# EAGLE design PCB_ESP32_v12 (EAGLE 9.7.0)
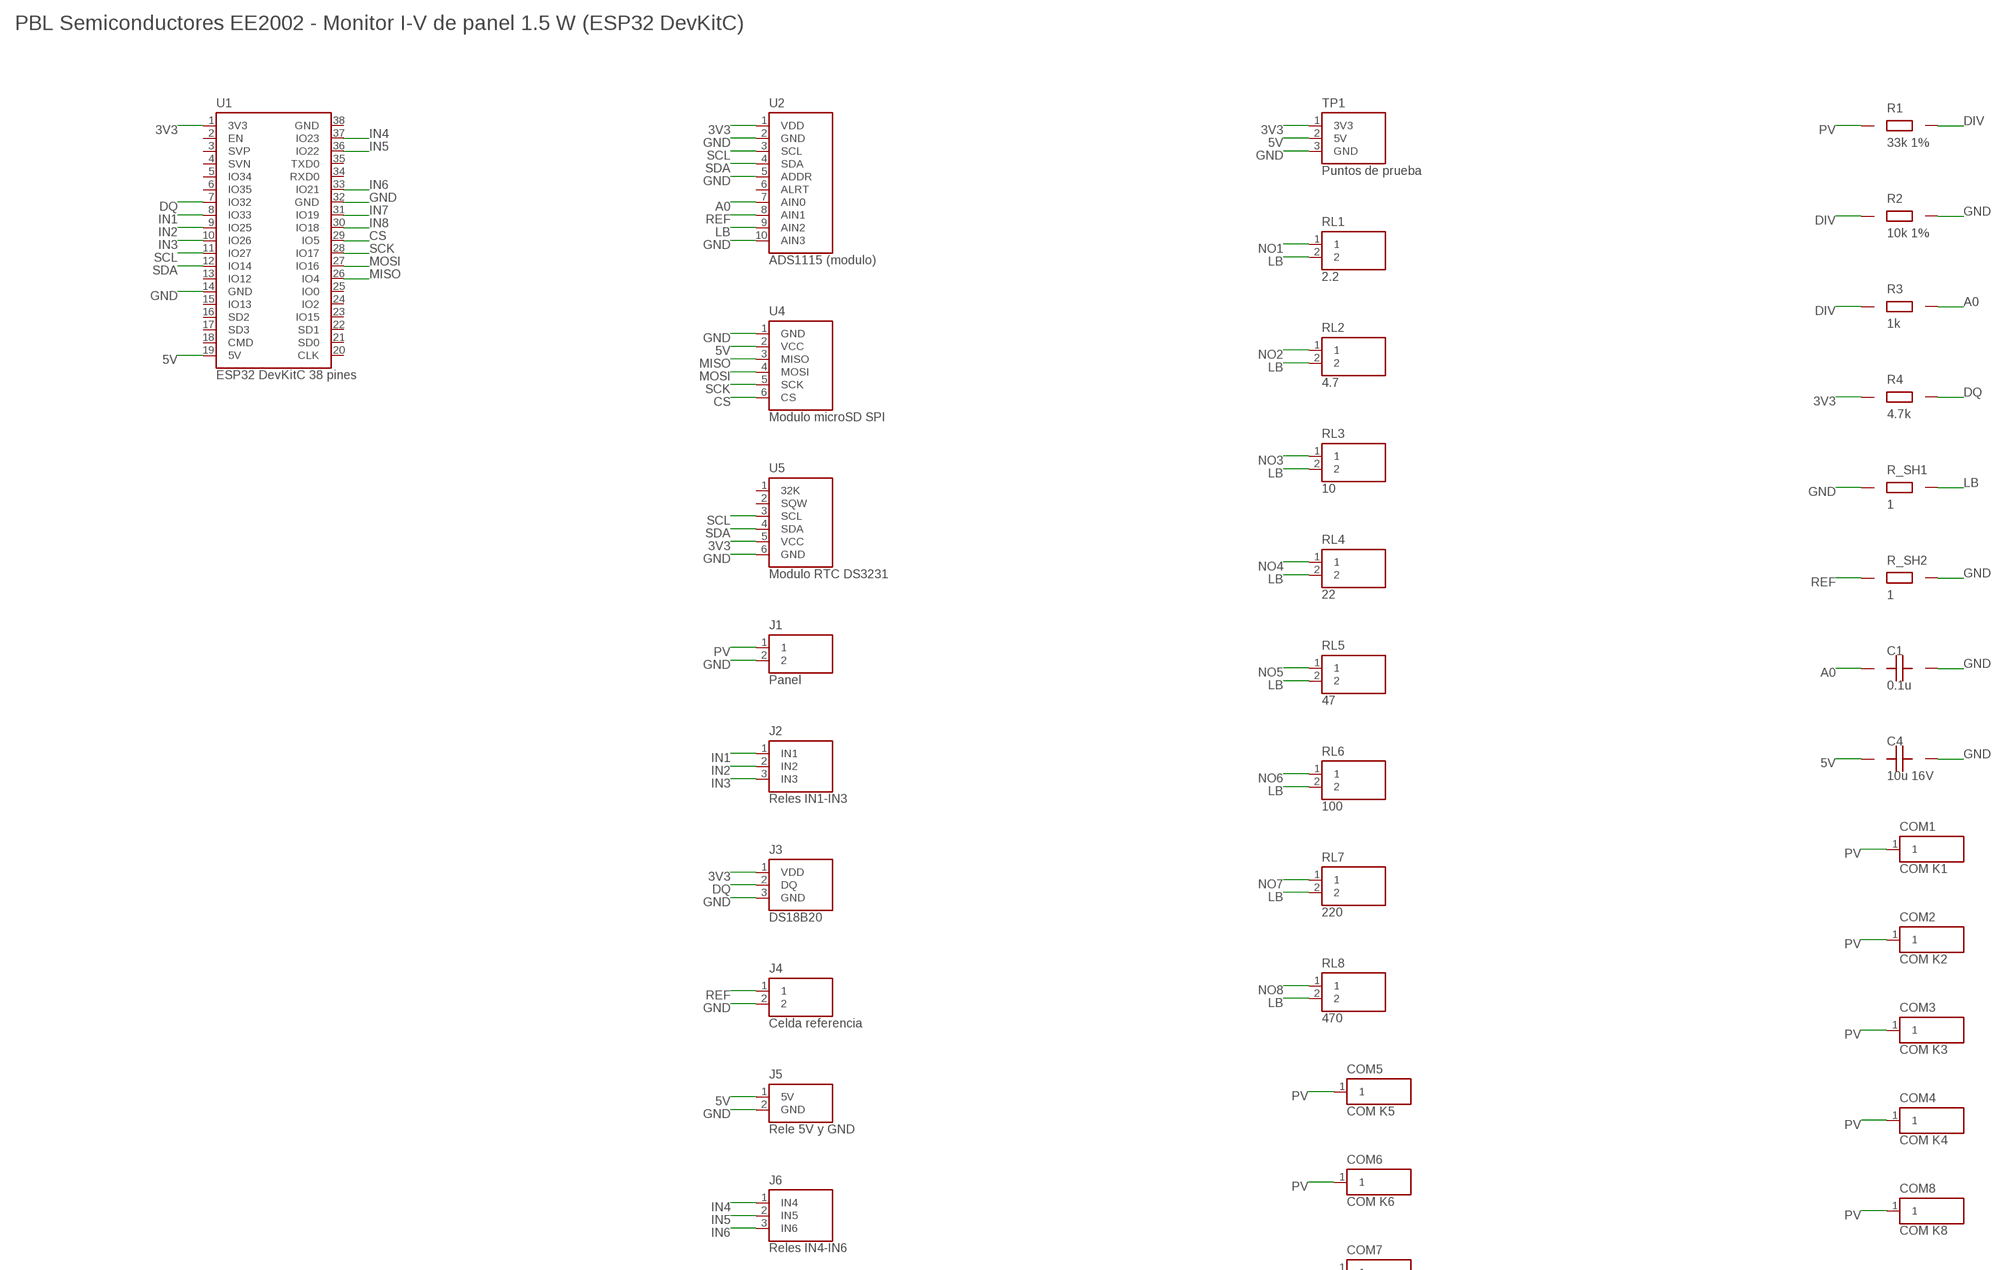
[diagram p0: schematic, sheet 1, part 1 of 2]
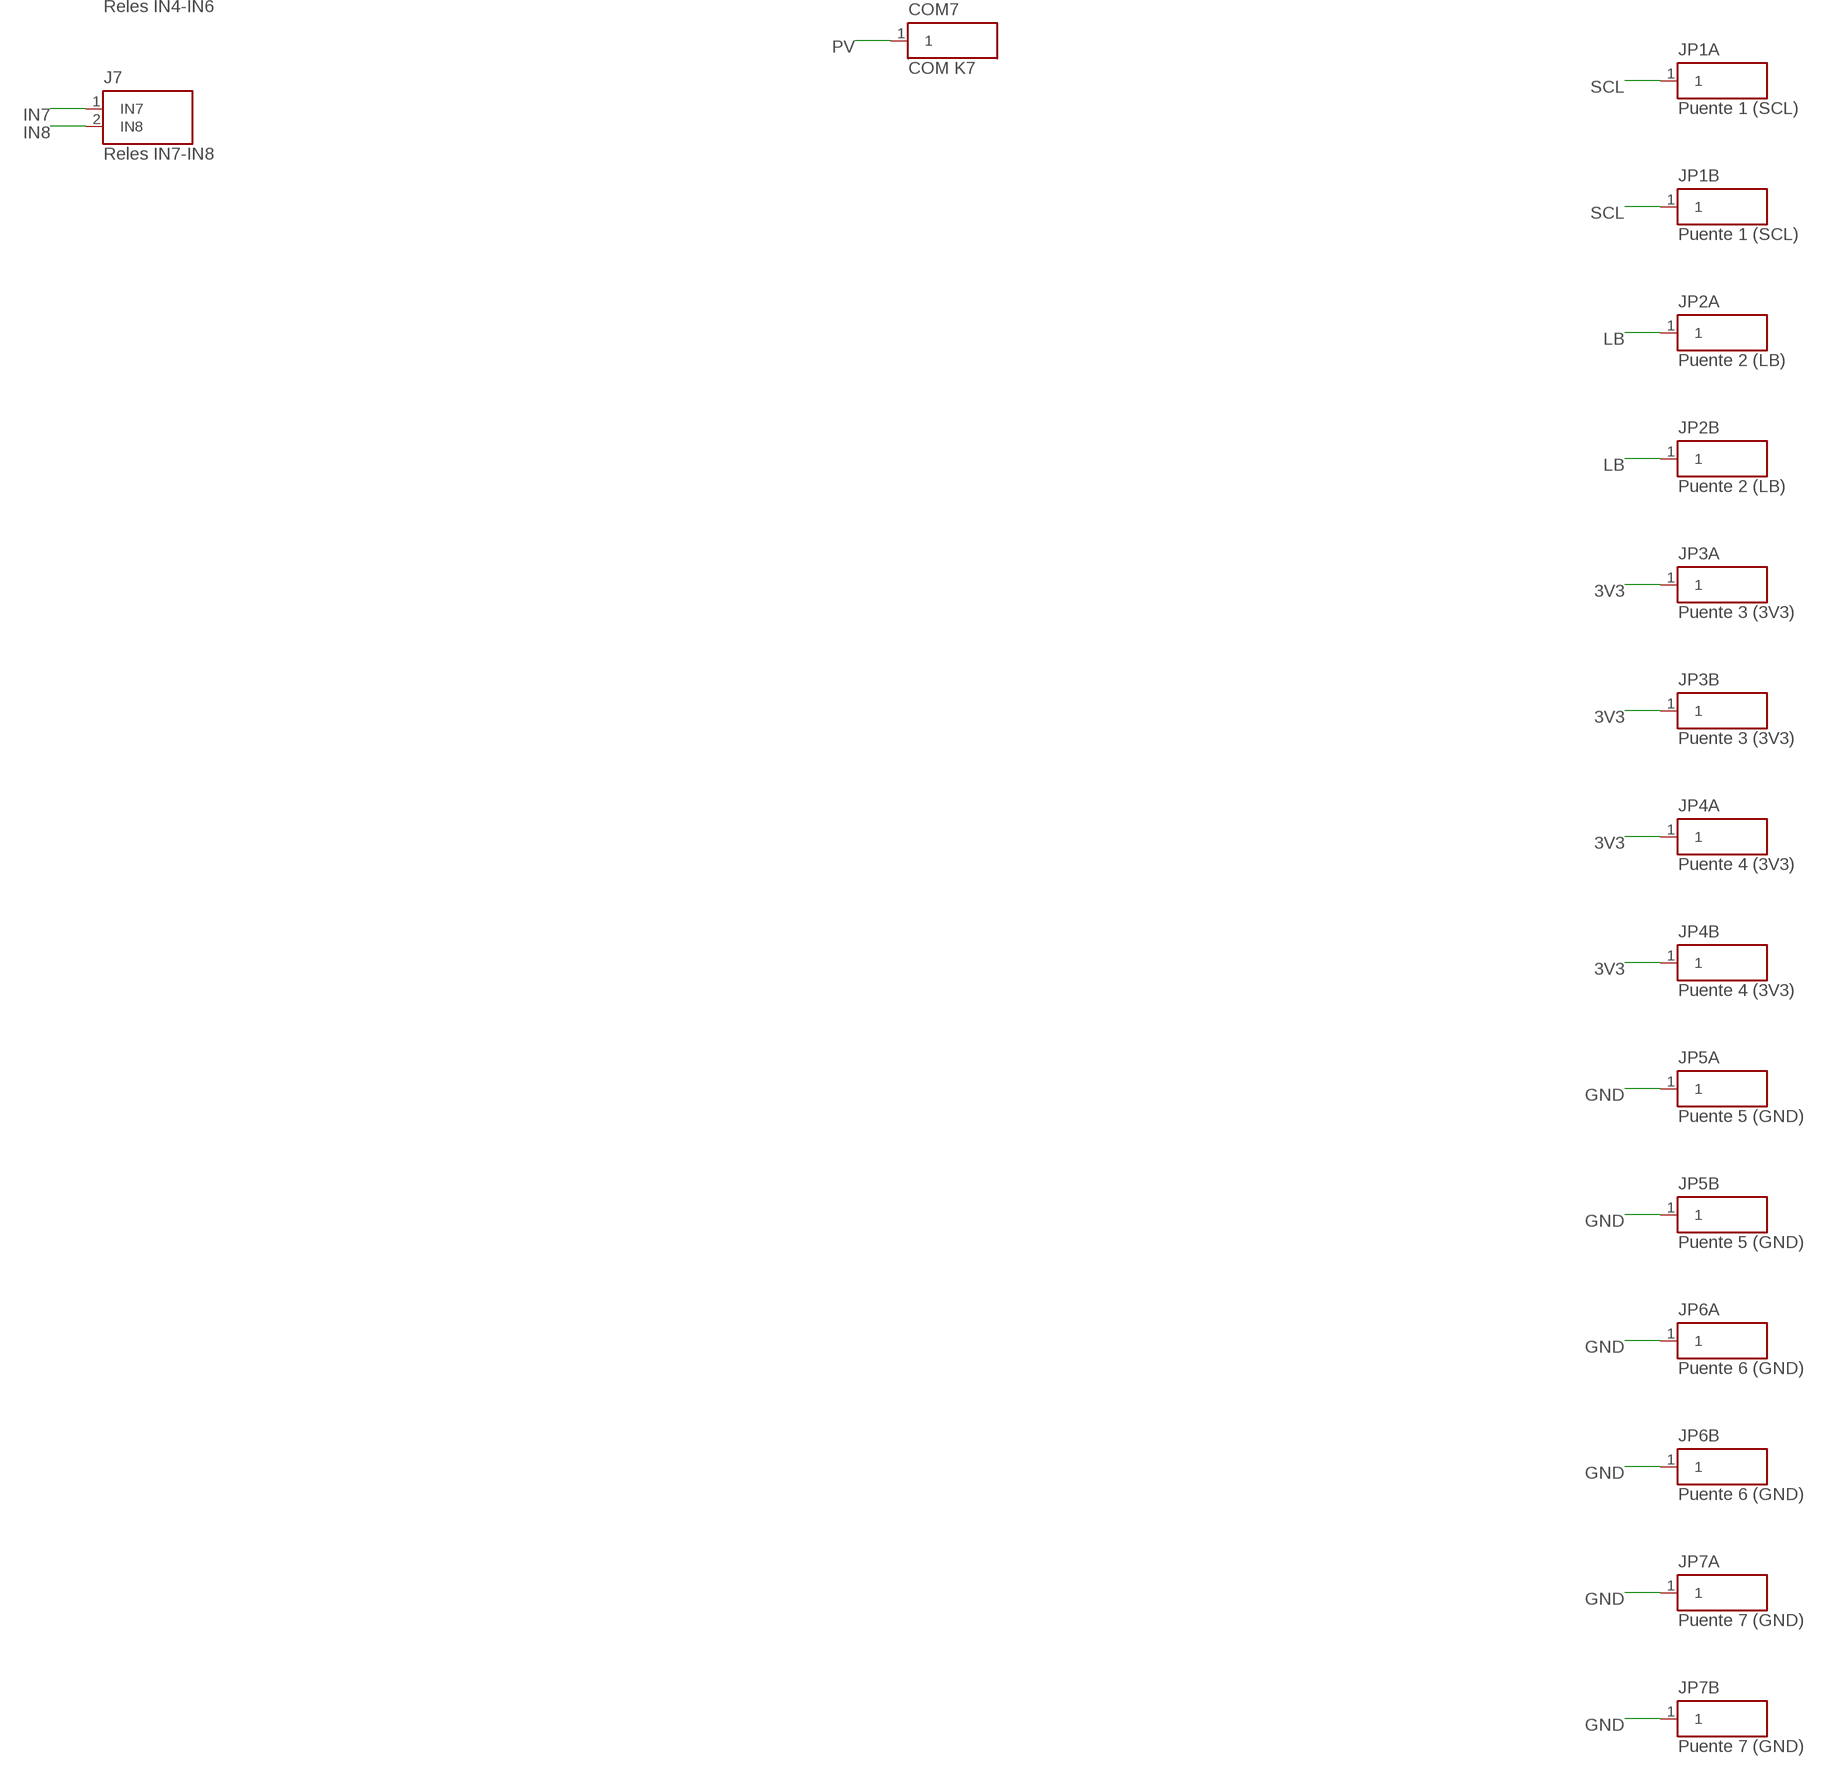
[diagram p1: schematic, sheet 1, part 2 of 2]

## Parts
C1  0.1u  C  [CAP_5MM]
C4  10u 16V  CP  [CAP_E_2_54]
COM1  COM K1  WIREPAD  [WIREPAD]
COM2  COM K2  WIREPAD  [WIREPAD]
COM3  COM K3  WIREPAD  [WIREPAD]
COM4  COM K4  WIREPAD  [WIREPAD]
COM5  COM K5  WIREPAD  [WIREPAD]
COM6  COM K6  WIREPAD  [WIREPAD]
COM7  COM K7  WIREPAD  [WIREPAD]
COM8  COM K8  WIREPAD  [WIREPAD]
J1  Panel  TERM2  [TERM2_5MM]
J2  Reles IN1-IN3  RELAY_L  [MALE_1X03]
J3  DS18B20  DS18B20_HDR  [MALE_1X03]
J4  Celda referencia  TERM2  [TERM2_5MM]
J5  Rele 5V y GND  RELAY_PWR  [MALE_1X02]
J6  Reles IN4-IN6  RELAY_RA  [MALE_1X03]
J7  Reles IN7-IN8  RELAY_RC  [MALE_1X02]
JP1A  Puente 1 (SCL)  JPAD  [JPAD]
JP1B  Puente 1 (SCL)  JPAD  [JPAD]
JP2A  Puente 2 (LB)  JPAD  [JPAD]
JP2B  Puente 2 (LB)  JPAD  [JPAD]
JP3A  Puente 3 (3V3)  JPAD  [JPAD]
JP3B  Puente 3 (3V3)  JPAD  [JPAD]
JP4A  Puente 4 (3V3)  JPAD  [JPAD]
JP4B  Puente 4 (3V3)  JPAD  [JPAD]
JP5A  Puente 5 (GND)  JPAD  [JPAD]
JP5B  Puente 5 (GND)  JPAD  [JPAD]
JP6A  Puente 6 (GND)  JPAD  [JPAD]
JP6B  Puente 6 (GND)  JPAD  [JPAD]
JP7A  Puente 7 (GND)  JPAD  [JPAD]
JP7B  Puente 7 (GND)  JPAD  [JPAD]
R1  33k 1%  R  [RES_V]
R2  10k 1%  R  [RES_V]
R3  1k  R  [RES_V]
R4  4.7k  R  [RES_V]
R_SH1  1  R  [RES_V]
R_SH2  1  R  [RES_V]
RL1  2.2  RLOAD  [RES_H_T]
RL2  4.7  RLOAD  [RES_H_T]
RL3  10  RLOAD  [RES_H_T]
RL4  22  RLOAD  [RES_H_T]
RL5  47  RLOAD  [RES_H_T]
RL6  100  RLOAD  [RES_H_T]
RL7  220  RLOAD  [RES_H_T]
RL8  470  RLOAD  [RES_H_T]
TP1  Puntos de prueba  TESTPOINTS  [MALE_1X03]
U1  ESP32 DevKitC 38 pines  ESP32  [ESP32_DEVKIT38]
U2  ADS1115 (modulo)  ADS1115  [SOCKET_1X10]
U4  Modulo microSD SPI  SDCARD  [SOCKET_1X06]
U5  Modulo RTC DS3231  DS3231  [SOCKET_1X06]

## Nets
3V3: J3.1(VDD) JP3A.1 JP3B.1 JP4A.1 JP4B.1 R4.1 TP1.1(3V3) U1.1(3V3) U2.1(VDD) U5.5(VCC)
5V: C4.1(+) J5.1(5V) TP1.2(5V) U1.19(5V) U4.2(VCC)
A0: C1.1 R3.2 U2.7(AIN0)
CS: U1.29(IO5) U4.6(CS)
DIV: R1.2 R2.1 R3.1
DQ: J3.2(DQ) R4.2 U1.7(IO32)
GND: C1.2 C4.2(-) J1.2 J3.3(GND) J4.2 J5.2(GND) JP5A.1 JP5B.1 JP6A.1 JP6B.1 JP7A.1 JP7B.1 R2.2 R_SH1.1 R_SH2.2 TP1.3(GND) U1.14(GND) U1.32(GND) U2.2(GND) U2.5(ADDR) U2.10(AIN3) U4.1(GND) U5.6(GND)
IN1: J2.1(IN1) U1.8(IO33)
IN2: J2.2(IN2) U1.9(IO25)
IN3: J2.3(IN3) U1.10(IO26)
IN4: J6.1(IN4) U1.37(IO23)
IN5: J6.2(IN5) U1.36(IO22)
IN6: J6.3(IN6) U1.33(IO21)
IN7: J7.1(IN7) U1.31(IO19)
IN8: J7.2(IN8) U1.30(IO18)
LB: JP2A.1 JP2B.1 R_SH1.2 RL1.2 RL2.2 RL3.2 RL4.2 RL5.2 RL6.2 RL7.2 RL8.2 U2.9(AIN2)
MISO: U1.26(IO4) U4.3(MISO)
MOSI: U1.27(IO16) U4.4(MOSI)
NO1: RL1.1
NO2: RL2.1
NO3: RL3.1
NO4: RL4.1
NO5: RL5.1
NO6: RL6.1
NO7: RL7.1
NO8: RL8.1
PV: COM1.1 COM2.1 COM3.1 COM4.1 COM5.1 COM6.1 COM7.1 COM8.1 J1.1 R1.1
REF: J4.1 R_SH2.1 U2.8(AIN1)
SCK: U1.28(IO17) U4.5(SCK)
SCL: JP1A.1 JP1B.1 U1.11(IO27) U2.3(SCL) U5.3(SCL)
SDA: U1.12(IO14) U2.4(SDA) U5.4(SDA)
Unconnected: U1.2(EN) U1.3(SVP) U1.4(SVN) U1.5(IO34) U1.6(IO35) U1.13(IO12) U1.15(IO13) U1.16(SD2) U1.17(SD3) U1.18(CMD) U1.20(CLK) U1.21(SD0) U1.22(SD1) U1.23(IO15) U1.24(IO2) U1.25(IO0) U1.34(RXD0) U1.35(TXD0) U1.38(GND) U2.6(ALRT) U5.1(32K) U5.2(SQW)

## Notes on the sheet
- PBL Semiconductores EE2002 - Monitor I-V de panel 1.5 W (ESP32 DevKitC)

## Library data of the parts
C1 = PCB_PBL_Semiconductores:C
C4 = PCB_PBL_Semiconductores:CP
COM1-COM8 = PCB_PBL_Semiconductores:WIREPAD
J1 J4 = PCB_PBL_Semiconductores:TERM2
J2 = PCB_PBL_Semiconductores:RELAY_L
J3 = PCB_PBL_Semiconductores:DS18B20_HDR
J5 = PCB_PBL_Semiconductores:RELAY_PWR
J6 = PCB_PBL_Semiconductores:RELAY_RA
J7 = PCB_PBL_Semiconductores:RELAY_RC
JP1A JP1B JP2A JP2B JP3A JP3B JP4A JP4B JP5A JP5B JP6A JP6B JP7A JP7B = PCB_PBL_Semiconductores:JPAD
R1-R4 R_SH1 R_SH2 = PCB_PBL_Semiconductores:R
RL1-RL8 = PCB_PBL_Semiconductores:RLOAD
TP1 = PCB_PBL_Semiconductores:TESTPOINTS
U1 = PCB_PBL_Semiconductores:ESP32
U2 = PCB_PBL_Semiconductores:ADS1115
U4 = PCB_PBL_Semiconductores:SDCARD
U5 = PCB_PBL_Semiconductores:DS3231

## Board
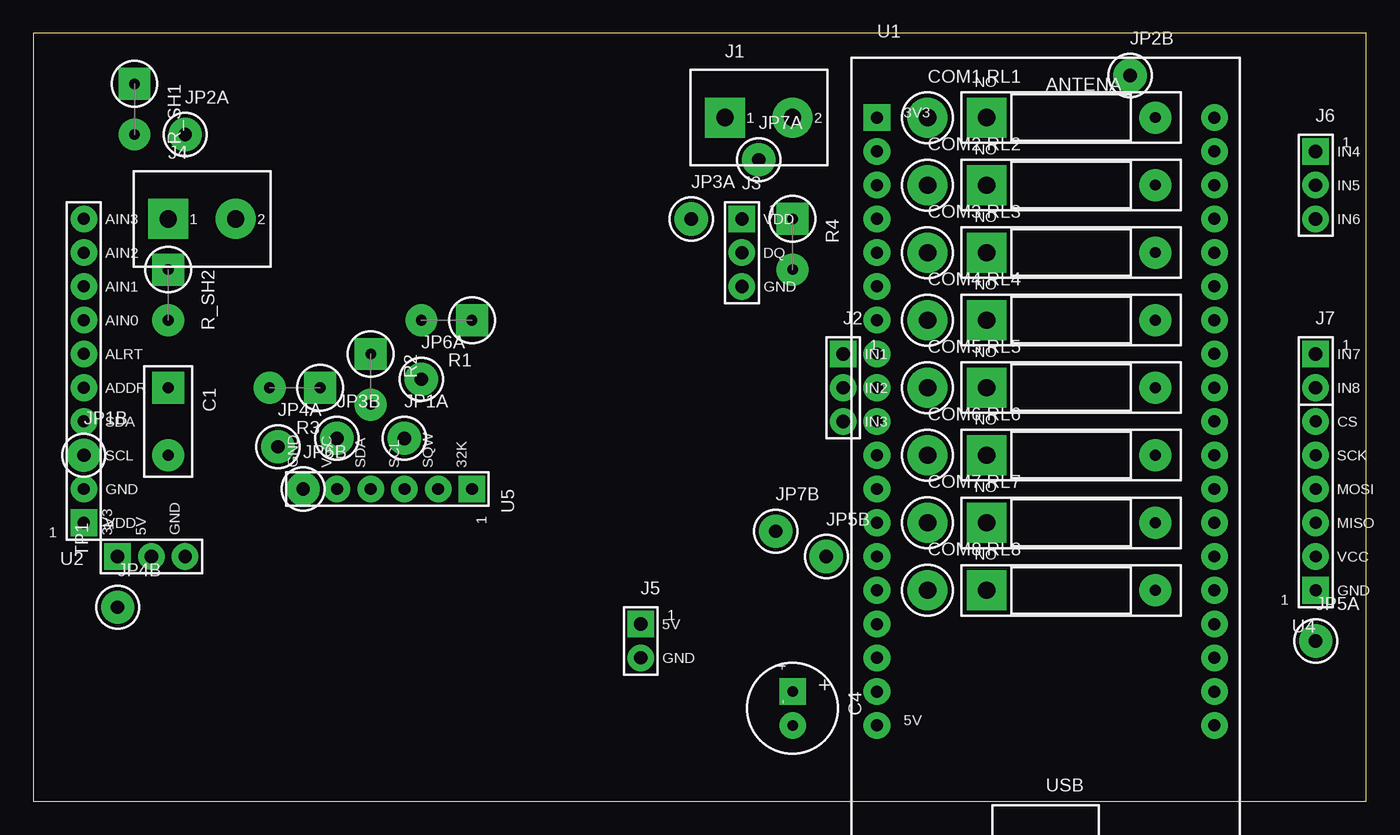
[diagram p2: board, top side]
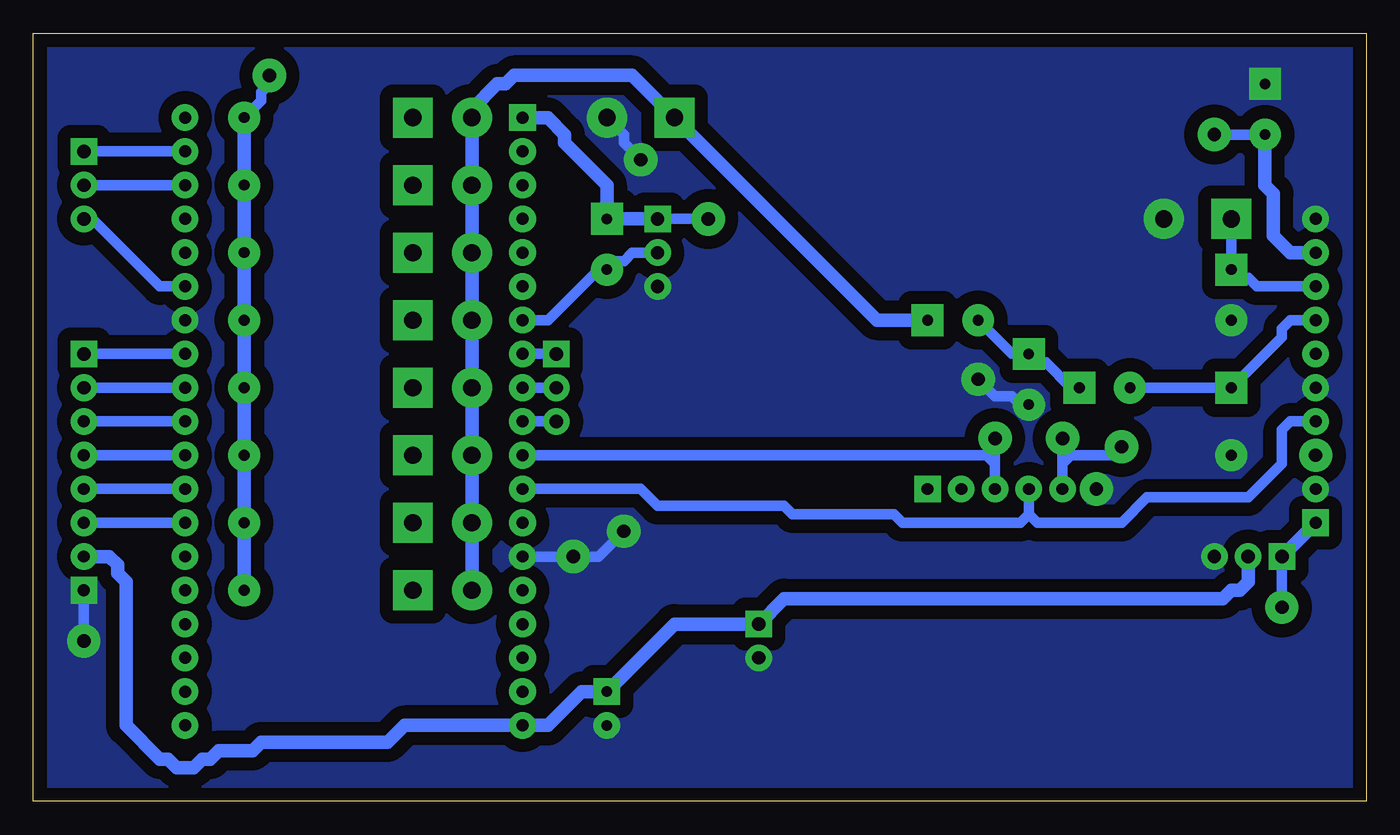
[diagram p3: board, bottom side, seen from below]

Size 100.33 x 57.79 mm. Coordinates in mm from the lower left corner, seen from the top.
Outline: 0,0 100.33,0 100.33,57.79 0,57.79 0,0
Copper layers (1*16): Top 0.035mm / dielectric 1.5mm / Bottom 0.035mm
Design rules "Fusion Electronics Design Rules": minimum track width 0.5mm, minimum drill 0.5mm, track to track 0.9mm, track to pad 0.9mm, pad to pad 0.4mm, via to via 0.4mm, smd to smd 6mil, copper to edge 1mm, drill to drill 0.3mm, minimum pad ring 0.4mm, minimum via ring 0.4mm, stop-mask expansion 4mil, vias tented up to drill 9999mil, thermal gap 0.6mm

### Footprints (pad centres in the part's own frame; a part is rotated, then mirrored left to right if it is on the bottom)
CAP_5MM = drill 0.8 pad 2.4 square: 1 0,0 | drill 0.8 pad 2.4 round: 2 5.08,0
CAP_E_2_54 = drill 0.8 pad 2 square: 1 0,0 | drill 0.8 pad 2 round: 2 2.54,0
WIREPAD = drill 1.3 pad 3 round: 1 0,0
TERM2_5MM = drill 1.3 pad 3 square: 1 0,0 | drill 1.3 pad 3 round: 2 5.08,0
MALE_1X03 = drill 1 pad 2 square: 1 0,0 | drill 1 pad 2 round: 2 0,-2.54; 3 0,-5.08
MALE_1X02 = drill 1 pad 2 square: 1 0,0 | drill 1 pad 2 round: 2 0,-2.54
JPAD = drill 1 pad 2.5 round: 1 0,0
RES_V = drill 0.8 pad 2.4 square: 1 0,0 | drill 0.8 pad 2.4 round: 2 3.81,0
RES_H_T = drill 1.3 pad 3 square: 1 0,0 | drill 0.8 pad 2.4 round: 2 12.7,0
ESP32_DEVKIT38 = drill 0.9 pad 2 square: 1 0,0 | drill 0.9 pad 2 round: 2 0,-2.54; 3 0,-5.08; 4 0,-7.62; 5 0,-10.16; 6 0,-12.7; 7 0,-15.24; 8 0,-17.78; 9 0,-20.32; 10 0,-22.86; 11 0,-25.4; 12 0,-27.94; 13 0,-30.48; 14 0,-33.02; 15 0,-35.56; 16 0,-38.1; 17 0,-40.64; 18 0,-43.18; 19 0,-45.72; 20 25.4,-45.72; 21 25.4,-43.18; 22 25.4,-40.64; 23 25.4,-38.1; 24 25.4,-35.56; 25 25.4,-33.02; 26 25.4,-30.48; 27 25.4,-27.94; 28 25.4,-25.4; 29 25.4,-22.86; 30 25.4,-20.32; 31 25.4,-17.78; 32 25.4,-15.24; 33 25.4,-12.7; 34 25.4,-10.16; 35 25.4,-7.62; 36 25.4,-5.08; 37 25.4,-2.54; 38 25.4,0
SOCKET_1X10 = drill 0.9 pad 2 square: 1 0,0 | drill 0.9 pad 2 round: 2 0,-2.54; 3 0,-5.08; 4 0,-7.62; 5 0,-10.16; 6 0,-12.7; 7 0,-15.24; 8 0,-17.78; 9 0,-20.32; 10 0,-22.86
SOCKET_1X06 = drill 0.9 pad 2 square: 1 0,0 | drill 0.9 pad 2 round: 2 0,-2.54; 3 0,-5.08; 4 0,-7.62; 5 0,-10.16; 6 0,-12.7

### Placement (x,y rotation side)
C1  10.16,31.12 270 top
C4  57.15,8.26 270 top
COM1  67.31,51.43 0 top
COM2  67.31,46.35 0 top
COM3  67.31,41.27 0 top
COM4  67.31,36.2 0 top
COM5  67.31,31.12 0 top
COM6  67.31,26.04 0 top
COM7  67.31,20.96 0 top
COM8  67.31,15.88 0 top
J1  52.07,51.43 0 top
J2  60.96,33.66 0 top
J3  53.34,43.82 0 top
J4  10.16,43.82 0 top
J5  45.72,13.34 0 top
J6  96.52,48.9 0 top
J7  96.52,33.66 0 top
JP1A  27.94,27.3 0 top
JP1B  3.81,26.04 0 top
JP2A  11.43,50.16 0 top
JP2B  82.55,54.61 0 top
JP3A  49.53,43.82 0 top
JP3B  22.86,27.3 0 top
JP4A  18.41,26.67 0 top
JP4B  6.35,14.61 0 top
JP5A  96.52,12.07 0 top
JP5B  59.69,18.41 0 top
JP6A  29.21,31.75 0 top
JP6B  20.32,23.5 0 top
JP7A  54.61,48.26 0 top
JP7B  55.88,20.32 0 top
R1  33.02,36.2 180 top
R2  25.4,33.66 270 top
R3  21.59,31.12 180 top
R4  57.15,43.82 270 top
R_SH1  7.62,53.98 270 top
R_SH2  10.16,40.01 270 top
RL1  71.75,51.43 0 top
RL2  71.75,46.35 0 top
RL3  71.75,41.27 0 top
RL4  71.75,36.2 0 top
RL5  71.75,31.12 0 top
RL6  71.75,26.04 0 top
RL7  71.75,20.96 0 top
RL8  71.75,15.88 0 top
TP1  6.35,18.41 90 top
U1  63.5,51.43 0 top
U2  3.81,20.96 180 top
U4  96.52,15.88 180 top
U5  33.02,23.5 270 top

### Tracks (layer width: path | path; a pad name or v marks a point on that pad's centre or on a via)
3V3
  Bottom 0.8: J3.1 JP3A.1 | 22.86,25.4 U5.5 22.86,25.4 | 22.86,25.4 JP3B.1 | 22.86,25.4 22.23,26.04 19.05,26.04 JP4A.1 | TP1.1 JP4B.1
  Bottom 1: U1.1 61.59,51.43 60.33,50.16 60.33,49.53 57.15,46.35 R4.1 J3.1 | TP1.1 U2.1
  tDocu 0.3: JP3A.1 JP3B.1 | JP4A.1 JP4B.1
5V
  Bottom 1: TP1.2 8.89,16.51 9.53,15.88 10.16,15.88 10.79,15.24 43.81,15.24 J5.1 52.07,13.34 C4.1 59.05,8.26 61.59,5.72 U1.19 72.39,5.72 73.66,4.45 83.19,4.45 83.82,3.81 86.36,3.81 87,3.18 87.63,3.18 88.27,2.54 89.53,2.54 90.17,3.18 90.81,3.18 93.34,5.72 93.34,16.51 93.98,17.15 93.98,17.78 94.61,18.41 U4.2
A0
  Bottom 0.8: R3.2 C1.1 6.35,34.93 6.35,35.56 5.71,36.2 U2.7
CS
  Bottom 0.8: U1.29 U4.6
DIV
  Bottom 0.8: R1.2 26.67,33.66 R2.1 24.77,33.02 24.13,33.02 22.23,31.12 R3.1
DQ
  Bottom 0.8: U1.7 61.59,36.2 57.78,40.01 R4.2 56.52,40.64 55.88,40.64 55.24,41.27 J3.2
GND
  Bottom 0.8: U4.1 JP5A.1 | JP5B.1 U1.14 JP5B.1 | R2.2 26.04,29.84 26.67,30.48 27.94,30.48 JP6A.1 | J1.2 55.88,50.16 55.88,49.53 JP7A.1 | JP5B.1 57.78,18.41 JP7B.1
  tDocu 0.3: JP5A.1 JP5B.1 | JP6A.1 JP6B.1 | JP7A.1 JP7B.1
  pour Bottom (isolate 1, no thermals): 0.8,0.8 99.53,0.8 99.53,56.99 0.8,56.99
IN1
  Bottom 0.8: U1.8 J2.1
IN2
  Bottom 0.8: U1.9 J2.2
IN3
  Bottom 0.8: U1.10 J2.3
IN4
  Bottom 0.8: U1.37 J6.1
IN5
  Bottom 0.8: U1.36 J6.2
IN6
  Bottom 0.8: U1.33 90.81,38.74 95.89,43.82 J6.3
IN7
  Bottom 0.8: U1.31 J7.1
IN8
  Bottom 0.8: U1.30 J7.2
LB
  Bottom 0.8: R_SH1.2 JP2A.1 | RL1.2 83.19,52.71 83.19,53.34 82.55,53.98 JP2B.1
  Bottom 1: U2.9 5.71,41.27 6.99,42.55 6.99,45.72 7.62,46.35 R_SH1.2 | RL1.2 RL2.2 RL3.2 RL4.2 RL5.2 RL6.2 RL7.2 RL8.2
  tDocu 0.3: JP2A.1 JP2B.1
MISO
  Bottom 0.8: U1.26 U4.3
MOSI
  Bottom 0.8: U1.27 U4.4
PV
  Bottom 1: COM8.1 COM7.1 COM6.1 COM5.1 COM4.1 COM3.1 COM2.1 COM1.1 67.31,52.07 65.41,53.98 64.77,53.98 64.14,54.61 55.24,54.61 J1.1 36.83,36.2 R1.1
REF
  Bottom 0.8: J4.1 R_SH2.1 9.53,39.37 8.89,39.37 8.26,38.74 U2.8
SCK
  Bottom 0.8: U1.28 U4.5
SCL
  Bottom 0.8: U1.11 28.57,26.04 27.94,25.4 | 27.94,25.4 U5.3 27.94,25.4 | 27.94,25.4 JP1A.1
  tDocu 0.3: JP1A.1 JP1B.1
SDA
  Bottom 0.8: U1.12 54.61,23.5 53.34,22.23 43.81,22.23 43.18,21.59 35.56,21.59 34.92,20.96 26.04,20.96 25.4,21.59 | 25.4,21.59 U5.4 | 25.4,21.59 24.77,20.96 18.41,20.96 16.51,22.86 8.89,22.86 6.35,25.4 6.35,27.94 5.71,28.58 U2.4

### Text on the board
tPlace: 1 | 2 | IN4 | IN5 | AIN3 | 1 | 2 | VDD | IN6 | AIN2 | DQ | AIN1 | GND | AIN0 | ALRT | IN1 | IN7 | ADDR | IN2 | IN8 | SDA | IN3 | CS | SCL | SCK | GND | VCC | SDA | SCL | SQW | 32K | GND | MOSI | VDD | MISO | 3V3 | 5V | GND | VCC | GND | 5V | GND | + | -